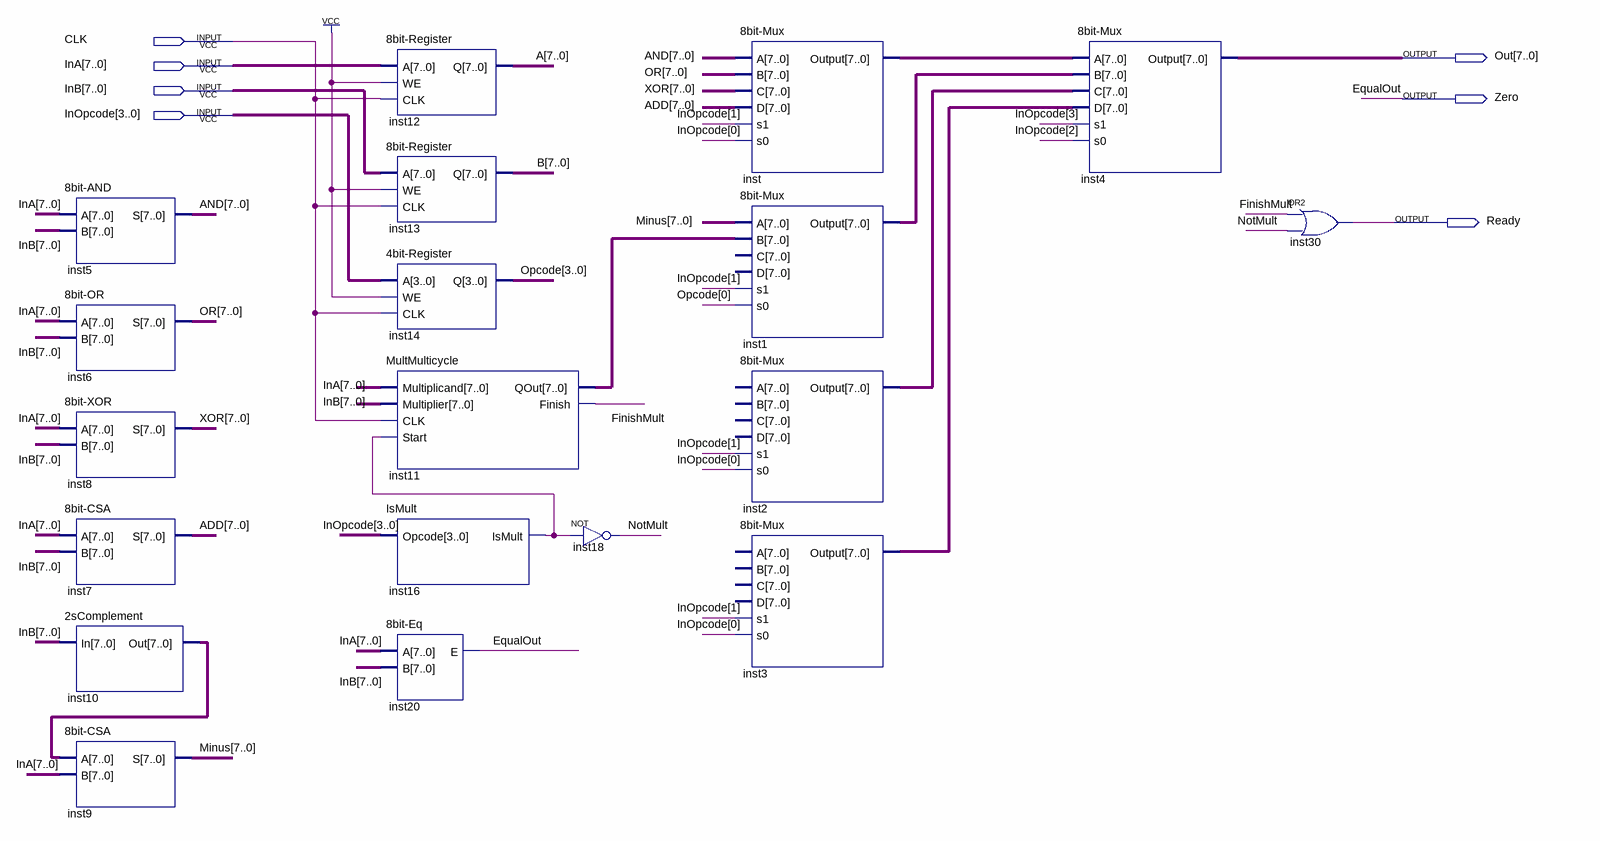
[diagram p0: schematic sheet]
// Quartus schematic ALU.bdf as structural Verilog: 19 symbols, 7 pins
module ALU (
  input  CLK,
  input  [7:0] InA,
  input  [7:0] InB,
  input  [3:0] InOpcode,
  output [7:0] Out,
  output Zero,
  output Ready
);

  wire FinishMult, inst16_ismult, NotMult;
  wire [3:0] Opcode;
  wire [7:0] A, ADD, AND, B, inst1_output, inst2_output, inst3_output, inst10_out, inst11_qout, inst_output,
       Minus, OR, XOR;

  \8bit-AND  inst5 (.A(InA), .B(InB), .S(AND));
  \8bit-OR  inst6 (.A(InA), .B(InB), .S(OR));
  \8bit-XOR  inst8 (.A(InA), .B(InB), .S(XOR));
  \8bit-CSA  inst7 (.A(InA), .B(InB), .S(ADD));
  \2sComplement  inst10 (.In(InB), .Out(inst10_out));
  \8bit-CSA  inst9 (.A(inst10_out), .B(InA), .S(Minus));
  \8bit-Register  inst12 (.A(InA), .WE(1'b1), .CLK(CLK), .Q(A));
  \8bit-Register  inst13 (.A(InB), .WE(1'b1), .CLK(CLK), .Q(B));
  \4bit-Register  inst14 (.A(InOpcode), .WE(1'b1), .CLK(CLK), .Q(Opcode));
  MultMulticycle inst11 (
    .Multiplicand(InA), .Multiplier(InB), .CLK(CLK), .Start(inst16_ismult), .QOut(inst11_qout),
    .Finish(FinishMult));
  IsMult inst16 (.Opcode(InOpcode), .IsMult(inst16_ismult));
  \8bit-Eq  inst20 (.A(InA), .B(InB), .E(Zero));
  not inst18 (NotMult, inst16_ismult);
  \8bit-Mux  inst (.A(AND), .B(OR), .C(XOR), .D(ADD), .s1(InOpcode[1]), .s0(InOpcode[0]), .Output(inst_output));
  \8bit-Mux  inst1 (.A(Minus), .B(inst11_qout), .s1(InOpcode[1]), .s0(Opcode[0]), .Output(inst1_output));  // open: C, D
  \8bit-Mux  inst2 (.s1(InOpcode[1]), .s0(InOpcode[0]), .Output(inst2_output));  // open: A, B, C, D
  \8bit-Mux  inst3 (.s1(InOpcode[1]), .s0(InOpcode[0]), .Output(inst3_output));  // open: A, B, C, D
  \8bit-Mux  inst4 (
    .A(inst_output), .B(inst1_output), .C(inst2_output), .D(inst3_output), .s1(InOpcode[3]),
    .s0(InOpcode[2]), .Output(Out));
  or inst30 (Ready, FinishMult, NotMult);

  // Other names for the same wires on the sheet: EqualOut = Zero
endmodule
